# Altium schematic sheet Task01.SchDoc
size A4
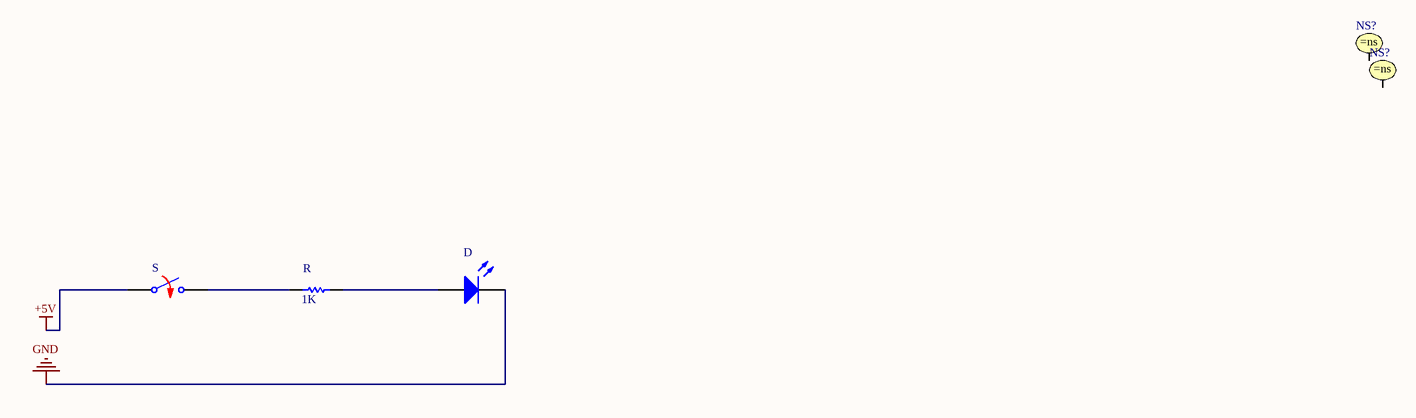
[diagram p0: Task01.SchDoc]

## Parts
(Parts that share a designator on the sheet are numbered #1, #2 ... from top to bottom, then left to right.)
D  Light-Emitting Diode  (value not drawn)
NS?#1  Node Set  (value not drawn)
NS?#2  Node Set  (value not drawn)
R  value 1K  (hidden comment: Resistor)
S  Switch Normally Opened  (value not drawn)

## Nets
+5V: S.1
GND: D.2(K)
NetD_1: D.1(A) R.2
NetR_1: R.1 S.2

Not connected (* = marked no-connect by the designer): NS?#1 1; NS?#2 1

## Library data of the parts
D = LED: AF: 1; BV: 0; BV_MAX: 1e99; EG: 1.11; FC: 0.5; IBV: 0.001; IS: 1e-14; MJSW: 0.33; NTUN: 30; TNOM: 27; XTI: 3; SimulationGenericComponent: True; CJO: 0; CJP: 0; CTA: 0; CTP: 0; FCS: 0.5; FV_MAX: 1e99; IKF: 0; IKR: 0; ISR: 1e-14; JSW: 0; JTUN: 0; JTUNSW: 0; KEG: 1; KF: 0; LEVEL: 1; N: 1; NBV: 1; NR: 1; NS: 1; PHP: 1; RS: 0; TCV: 0; TLEV: 0; TLEVC: 0; TM1: 0; TM2: 0; TPB: 0; TPHP: 0; TRS: 0; TRS2: 0; TT: 0; TTT1: 0; TTT2: 0; VJ: 1; XTITUN: 3
NS?#1 NS?#2 = .NS: SimulationGenericComponent: True
R = Resistor: TC1: 0; SimulationGenericComponent: True; TC2: 0
S = SW NO: closed: 0; Rclosed: 1m; Ropen: 1Meg; SimulationGenericComponent: True